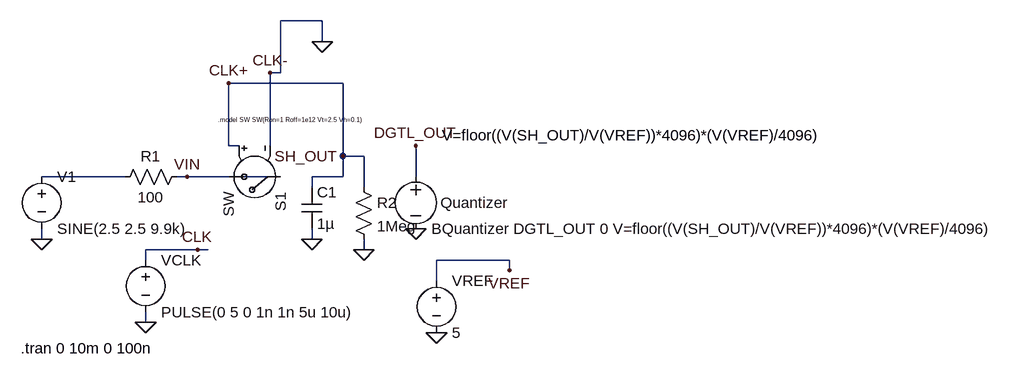
[diagram p0: schematic Draft3.asc]
Draft3.asc, the LTspice schematic file:
Version 4.1
SHEET 1 1704 680
WIRE 400 -192 336 -192
WIRE 400 -160 400 -192
WIRE 336 -112 336 -192
WIRE 336 -112 320 -112
WIRE 432 -96 256 -96
WIRE 256 0 256 -96
WIRE 272 0 256 0
WIRE 320 0 320 -112
WIRE 432 16 432 -96
WIRE 464 16 432 16
WIRE 96 48 -32 48
WIRE 192 48 176 48
WIRE 256 48 192 48
WIRE 336 48 272 48
WIRE 432 48 432 16
WIRE 432 48 384 48
WIRE 544 48 544 0
WIRE 384 64 384 48
WIRE 464 64 464 16
WIRE -32 144 -32 128
WIRE 384 144 384 128
WIRE 208 160 128 160
WIRE 224 160 208 160
WIRE 464 160 464 144
WIRE 128 176 128 160
WIRE 688 176 576 176
WIRE 688 192 688 176
WIRE 576 208 576 176
WIRE 128 272 128 256
FLAG 192 48 VIN
FLAG 384 144 0
FLAG 464 160 0
FLAG 544 0 DGTL_OUT
FLAG -32 144 0
FLAG 208 160 CLK
FLAG 576 288 0
FLAG 544 128 0
FLAG 432 16 SH_OUT
FLAG 128 272 0
FLAG 256 -96 CLK+
FLAG 320 -112 CLK-
FLAG 400 -160 0
FLAG 688 192 VREF
SYMBOL voltage -32 32 R0
SYMATTR InstName V1
SYMATTR Value SINE(2.5 2.5 9.9k)
SYMBOL res 192 32 R90
WINDOW 0 0 56 VBottom 2
WINDOW 3 32 56 VTop 2
SYMATTR InstName R1
SYMATTR Value 100
SYMBOL lib\\sym\\sw 352 48 R90
SYMATTR InstName S1
SYMBOL cap 368 64 R0
SYMATTR InstName C1
SYMATTR Value 1µ
SYMBOL res 448 48 R0
SYMATTR InstName R2
SYMATTR Value 1Meg
SYMBOL lib\\sym\\bv 544 32 R0
WINDOW 0 38 56 Left 2
SYMATTR InstName Quantizer
SYMATTR Value BQuantizer DGTL_OUT 0 V=floor((V(SH_OUT)/V(VREF))*4096)*(V(VREF)/4096)
SYMATTR Prefix V=floor((V(SH_OUT)/V(VREF))*4096)*(V(VREF)/4096)
SYMBOL voltage 128 160 R0
SYMATTR InstName VCLK
SYMATTR Value PULSE(0 5 0 1n 1n 5u 10u)
SYMBOL voltage 576 192 R0
WINDOW 123 0 0 Left 0
WINDOW 39 0 0 Left 0
SYMATTR InstName VREF
SYMATTR Value 5
TEXT -64 312 Left 2 !.tran 0 10m 0 100n
TEXT 240 -40 Left 0 !.model SW SW(Ron=1 Roff=1e12 Vt=2.5 Vh=0.1)
TEXT 584 -16 Left 2 !V=floor((V(SH_OUT)/V(VREF))*4096)*(V(VREF)/4096)

The netlist it stands for:
* Draft3.asc
V1 N001 0 SINE(2.5 2.5 9.9k)
R1 VIN N001 100
S1 N002 VIN CLK+ 0 SW
C1 CLK+ 0 1µ
R2 CLK+ 0 1Meg
V§Quantizer DGTL_OUT 0 BQuantizer DGTL_OUT 0 V=floor((V(SH_OUT)/V(VREF))*4096)*(V(VREF)/4096)
VCLK CLK 0 PULSE(0 5 0 1n 1n 5u 10u)
VREF VREF 0 5
.tran 0 10m 0 100n
.model SW SW(Ron=1 Roff=1e12 Vt=2.5 Vh=0.1)
V=floor((V(SH_OUT)/V(VREF))*4096)*(V(VREF)/4096)
.backanno
.end